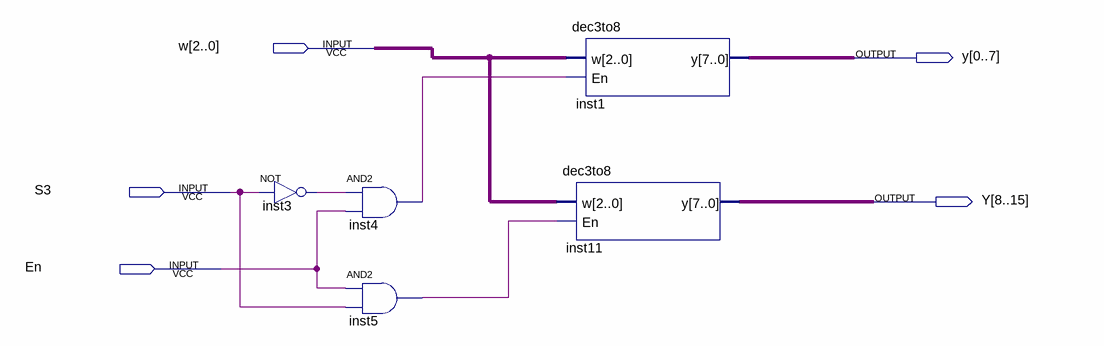
[diagram p0: schematic sheet]
// Quartus schematic dec3to8.bdf as structural Verilog: 5 symbols, 5 pins
module dec3to8 (
  input  [2:0] w,
  input  S3,
  input  En,
  output [0:15] Y
);

  wire inst3_out, inst4_out, inst5_out;

  not inst3 (inst3_out, S3);
  and inst4 (inst4_out, inst3_out, En);
  and inst5 (inst5_out, En, S3);
  dec3to8 inst1 (.w(w), .En(inst4_out), .y(Y[0:7]));
  dec3to8 inst11 (.w(w), .En(inst5_out), .y(Y[8:15]));
endmodule
